# Altium schematic sheet Accelerometers.SchDoc: =DT_SCH_Title
size A4; Organization: Droid Technologies; SheetNumber: 9; SheetTotal: 22
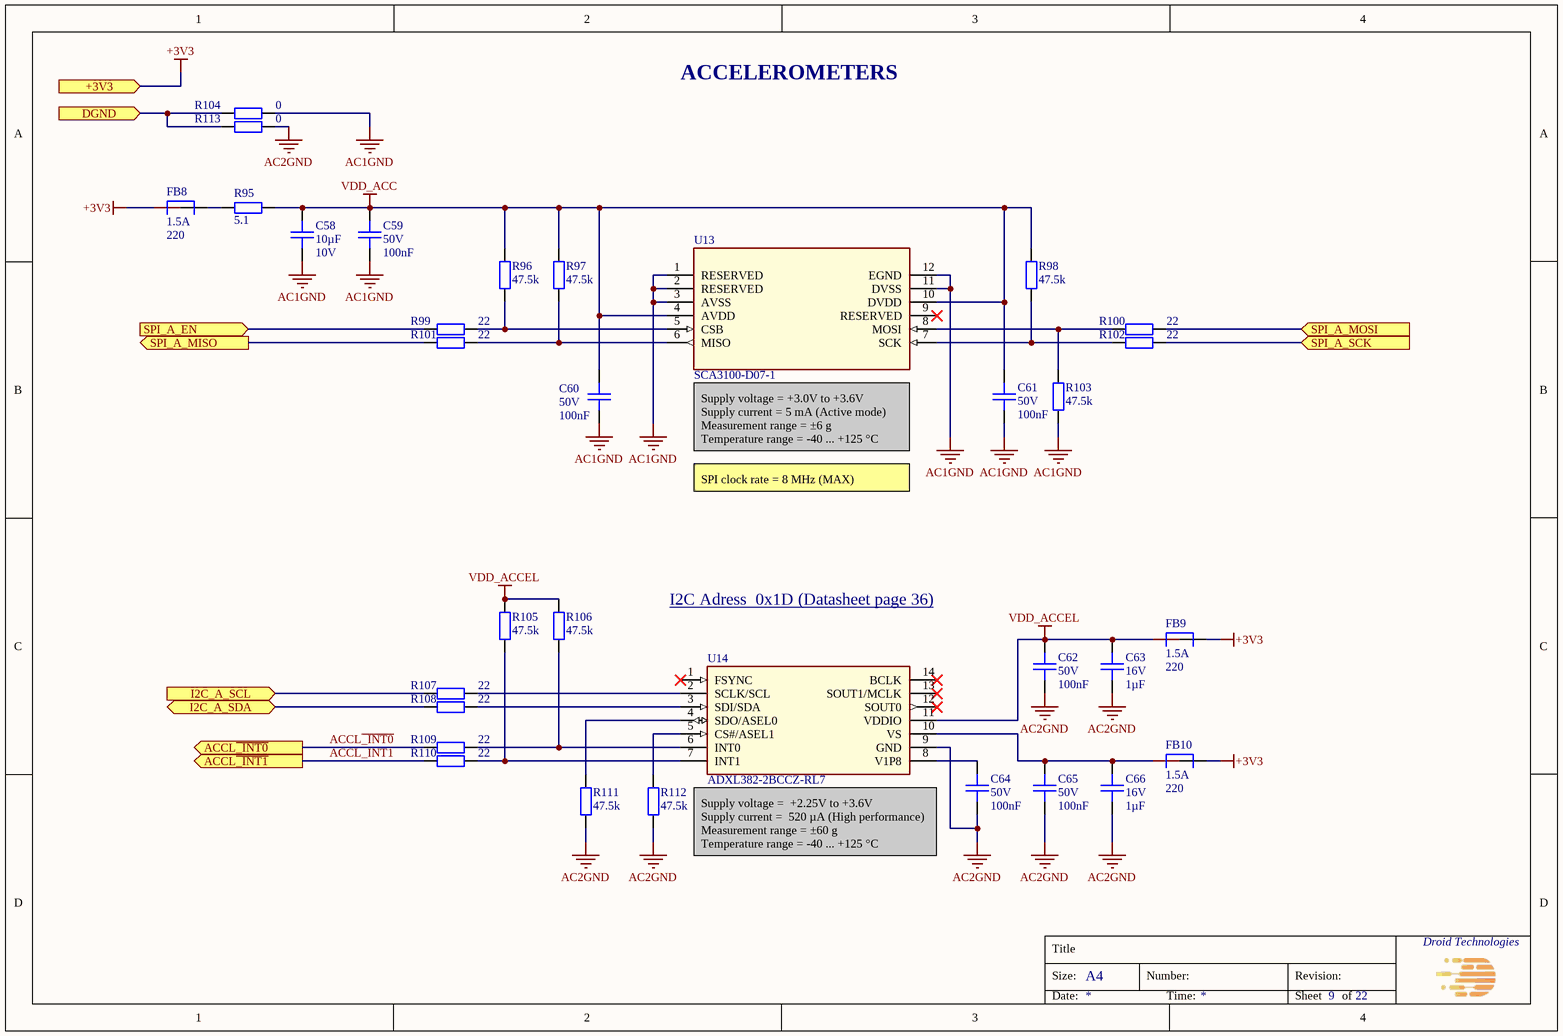
[diagram p0: Accelerometers.SchDoc]

## Parts
C58  Capacitance: 10µF  Voltage Rating: 10V  [CAPC200X125X145L50]  (hidden comment: CGA4J1X8L1A106K125AC)
C59  Voltage Rating: 50V  Capacitance: 100nF  [CAPC100x50x50L25]  (hidden comment: GCM155L8EH104KE07D)
C60  Voltage Rating: 50V  Capacitance: 100nF  [CAPC100x50x50L25]  (hidden comment: GCM155L8EH104KE07D)
C61  Voltage Rating: 50V  Capacitance: 100nF  [CAPC100x50x50L25]  (hidden comment: GCM155L8EH104KE07D)
C62  Voltage Rating: 50V  Capacitance: 100nF  [CAPC100x50x50L25]  (hidden comment: GCM155L8EH104KE07D)
C63  Voltage Rating: 16V  Capacitance: 1µF  [CAPC160X80X90L35]  (hidden comment: GCG188L8EE105KA07D)
C64  Voltage Rating: 50V  Capacitance: 100nF  [CAPC100x50x50L25]  (hidden comment: GCM155L8EH104KE07D)
C65  Voltage Rating: 50V  Capacitance: 100nF  [CAPC100x50x50L25]  (hidden comment: GCM155L8EH104KE07D)
C66  Voltage Rating: 16V  Capacitance: 1µF  [CAPC160X80X90L35]  (hidden comment: GCG188L8EE105KA07D)
FB8  Imax: 1.5A  Impedance: 220  [BEADC160X80X95L40]  (hidden comment: BLM18KG221BH1D)
FB9  Imax: 1.5A  Impedance: 220  [BEADC160X80X95L40]  (hidden comment: BLM18KG221BH1D)
FB10  Imax: 1.5A  Impedance: 220  [BEADC160X80X95L40]  (hidden comment: BLM18KG221BH1D)
R95  Resistance: 5.1  [RESC100X50X40L25]  (hidden comment: RC0402FR-075R1L)
R96  Resistance: 47.5k  [RESC100X50X40L25]  (hidden comment: RC0402FR-0747K5L)
R97  Resistance: 47.5k  [RESC100X50X40L25]  (hidden comment: RC0402FR-0747K5L)
R98  Resistance: 47.5k  [RESC100X50X40L25]  (hidden comment: RC0402FR-0747K5L)
R99  Resistance: 22  [RESC100X50X40L25]  (hidden comment: RC0402FR-0722RL)
R100  Resistance: 22  [RESC100X50X40L25]  (hidden comment: RC0402FR-0722RL)
R101  Resistance: 22  [RESC100X50X40L25]  (hidden comment: RC0402FR-0722RL)
R102  Resistance: 22  [RESC100X50X40L25]  (hidden comment: RC0402FR-0722RL)
R103  Resistance: 47.5k  [RESC100X50X40L25]  (hidden comment: RC0402FR-0747K5L)
R104  Resistance: 0  [RESC160X80X55L30]  (hidden comment: RC0603FR-070RL)
R105  Resistance: 47.5k  [RESC100X50X40L25]  (hidden comment: RC0402FR-0747K5L)
R106  Resistance: 47.5k  [RESC100X50X40L25]  (hidden comment: RC0402FR-0747K5L)
R107  Resistance: 22  [RESC100X50X40L25]  (hidden comment: RC0402FR-0722RL)
R108  Resistance: 22  [RESC100X50X40L25]  (hidden comment: RC0402FR-0722RL)
R109  Resistance: 22  [RESC100X50X40L25]  (hidden comment: RC0402FR-0722RL)
R110  Resistance: 22  [RESC100X50X40L25]  (hidden comment: RC0402FR-0722RL)
R111  Resistance: 47.5k  [RESC100X50X40L25]  (hidden comment: RC0402FR-0747K5L)
R112  Resistance: 47.5k  [RESC100X50X40L25]  (hidden comment: RC0402FR-0747K5L)
R113  Resistance: 0  [RESC160X80X55L30]  (hidden comment: RC0603FR-070RL)
U13  SCA3100-D07-1  [SCA3100-D07-1]
U14  ADXL382-2BCCZ-RL7  [14-LGA (2.9x2.8)]

## Ports
+3V3 (in), ACCL~{_INT0} (out), ACCL~{_INT1} (out), DGND (in), I2C_A_SCL (in), I2C_A_SDA (bidir), SPI_A_EN (in), SPI_A_MISO (out), SPI_A_MOSI (in), SPI_A_SCK (in)

## Nets
+3V3: FB8.1 FB9.2 FB10.2 ; port +3V3
AC1GND: C58.1 C59.1 C60.1 C61.1 R103.1 R104.1 U13.1(RESERVED) U13.2(RESERVED) U13.3(AVSS) U13.11(DVSS) U13.12(EGND)
AC2GND: C62.1 C63.1 C64.1 C65.1 C66.1 R111.1 R112.1 R113.1 U14.9(GND)
VDD_ACC: C58.2 C59.2 C60.2 C61.2 R95.2 R96.2 R97.2 R98.2 U13.4(AVDD) U13.10(DVDD)
VDD_ACCEL: C62.2 C63.2 FB9.1 R105.2 R106.2 U14.11(VDDIO)
ACCL~{_INT0}: R109.1 ; port ACCL~{_INT0}
ACCL~{_INT1}: R110.1 ; port ACCL~{_INT1}
DGND: R104.2 R113.2 ; port DGND
I2C_A_SCL: R107.1 ; port I2C_A_SCL
I2C_A_SDA: R108.1 ; port I2C_A_SDA
SPI_A_EN: R99.1 ; port SPI_A_EN
SPI_A_MISO: R101.1 ; port SPI_A_MISO
SPI_A_MOSI: R100.2 ; port SPI_A_MOSI
SPI_A_SCK: R102.2 ; port SPI_A_SCK
NetC64_2: C64.2 U14.8(V1P8)
NetC65_2: C65.2 C66.2 FB10.1 U14.10(VS)
NetFB8_2: FB8.2 R95.1
NetR96_1: R96.1 R99.2 U13.5(CSB)
NetR97_1: R97.1 R101.2 U13.6(MISO)
NetR98_1: R98.1 R102.1 U13.7(SCK)
NetR100_1: R100.1 R103.2 U13.8(MOSI)
NetR105_1: R105.1 R110.2 U14.7(INT1)
NetR106_1: R106.1 R109.2 U14.6(INT0)
NetR107_2: R107.2 U14.2(SCLK/SCL)
NetR108_2: R108.2 U14.3(SDI/SDA)
NetR111_2: R111.2 U14.4(SDO/ASEL0)
NetR112_2: R112.2 U14.5(CS#/ASEL1)

Not connected (* = marked no-connect by the designer): U13 9(RESERVED)*; U14 1(FSYNC)* 12(SOUT0)* 13(SOUT1/MCLK)* 14(BCLK)*

## Notes on the sheet
- ACCELEROMETERS
- (near U13) Supply voltage = +3.0V to +3.6V
  Supply current = 5 mA (Active mode)
  Measurement range = ±6 g
  Temperature range = -40 ... +125 °C
- SPI clock rate = 8 MHz (MAX)
- I2C Adress  0x1D (Datasheet page 36) <https://www.analog.com/media/en/technical-documentation/data-sheets/adxl382.pdf>
- Supply voltage =  +2.25V to +3.6V
  Supply current =  520 µA (High performance)
  Measurement range = ±60 g
  Temperature range = -40 ... +125 °C
- Title
- Size:
- A4
- Number:
- Revision:
- Date:
- Time:
- Sheet
- of

## Library data of the parts
C58 = CMP-001-1984-2: CAP CER 10UF 10V X8L 0805; Manufacturer: TDK Corporation; Tolerance: 10%; Op Temp min: -55°C; Op Temp max: 150°C; ComponentLink3Description: Digikey; Mounting Type: SM; Ratings: AEC-Q200; ComponentLink1Description: Datasheet; ComponentLink3URL: https://www.digikey.com/en/products/detail/tdk-corporation/CGA4J1X8L1A106K125AC/9991388; Lead Spacing: 0mm; MPN: CGA4J1X8L1A106K125AC; Size: 2.00mm x 1.25mm; Height max: 1.5mm; ComponentLink2URL: https://eu.mouser.com/ProductDetail/TDK/CGA4J1X8L1A106K125AC?qs=gZXFycFWdANzH%252B2UvJJjtQ%3D%3D; Package: 0805 (2012 Metric); ComponentLink2Description: Mouser; Dielectric: X8L; ComponentLink1URL: https://product.tdk.com/en/search/capacitor/ceramic/mlcc/info?part_no=CGA4J1X8L1A106K125AC
C59-C62 C64 C65 = CMP-001-1980-2: CAP CER 0.1UF 50V X8L 0402; Manufacturer: Murata Electronics; Op Temp max: 150°C; Op Temp min: -55°C; Tolerance: 10%; Height max: 550µm; ComponentLink3Description: Digikey; Mounting Type: SM; ComponentLink3URL: https://www.digikey.com/en/products/detail/murata-electronics/GCM155L8EH104KE07D/11618823; Package: 0402 (1005 Metric); Lead Spacing: 0mm; MPN: GCM155L8EH104KE07D; Size: 1.00mm x 0.50mm; Ratings: AEC-Q200; ComponentLink1URL: https://www.murata.com/en-us/products/productdetail?partno=GCM155L8EH104KE07%23; ComponentLink1Description: Datasheet; Dielectric: X8L; ComponentLink2Description: Mouser; ComponentLink2URL: https://eu.mouser.com/ProductDetail/Murata-Electronics/GCM155L8EH104KE07D?qs=1mbolxNpo8fQSHf0HYnZWw%3D%3D
C63 C66 = CMP-001-1982-2: CAP CER 1UF 16V X8L 0603; Manufacturer: Murata Electronics; Tolerance: 10%; Op Temp min: -55°C; Op Temp max: 150°C; ComponentLink3URL: https://www.digikey.com/en/products/detail/murata-electronics/GCG188L8EE105KA07D/10695125; Package: 0603 (1608 Metric); MPN: GCG188L8EE105KA07D; ComponentLink2URL: https://eu.mouser.com/ProductDetail/Murata-Electronics/GCG188L8EE105KA07D?qs=rrS6PyfT74dFMfTR80dVTA%3D%3D; Dielectric: X8L; Size: 1.60mm x 0.80mm; ComponentLink1Description: Datasheet; ComponentLink1URL: https://www.murata.com/en-us/products/productdetail?partno=GCG188L8EE105KA07%23; ComponentLink2Description: Mouser; Height max: 900µm; Mounting Type: SM; ComponentLink3Description: Digikey; Lead Spacing: 0mm; Ratings: AEC-Q200
FB8-FB10 = CMP-001-1981-1: FERRITE BEAD 220 OHM 0603 1LN; Manufacturer: Murata Electronics; DCR: 50m; Op Temp min: -55°C; Frequency: 100MHz; Op Temp max: 150°C; Number of Lines: 1; Mounting Type: SM; Size: 1.60mm x 0.80mm; ComponentLink2URL: https://eu.mouser.com/ProductDetail/Murata-Electronics/BLM18KG221BH1D?qs=sJ5gq5MLFXpgEHYBdWUtkQ%3D%3D; ComponentLink1Description: Datasheet; ComponentLink1URL: https://www.murata.com/en-us/products/productdata/8798137286686/QNFA9129.pdf; Lead Spacing: 0mm; Ratings: AEC-Q200; ComponentLink3Description: Digikey; ComponentLink3URL: https://www.digikey.com/en/products/detail/murata-electronics/BLM18KG221BH1D/6156000; Height max: 950µm; Package: 0603 (1608 Metric); ComponentLink2Description: Mouser; MPN: BLM18KG221BH1D
R95 = CMP-00125-8: RES 5.1 OHM 1% 1/16W 0402; Manufacturer: YAGEO; Power: 63mW; Temperature Coefficient: ±200ppm; Op Temp max: 155°C; Op Temp min: -55°C; ComponentLink3URL: https://www.digikey.com/en/products/detail/yageo/RC0402FR-075R1L/5917722; ComponentLink2Description: Mouser; ComponentLink2URL: https://eu.mouser.com/ProductDetail/YAGEO/RC0402FR-075R1L?qs=%2Fha2pyFaduhjtLcYvKXQ8B9EFTm6YmMloHxcmTFokS12j5yrT26S1A%3D%3D; Size: 1.00mm x 0.50mm; ComponentLink3Description: Digikey; Package: 0402 (1005 Metric); Ratings: -; Tolerance: 1%; MPN: RC0402FR-075R1L; ComponentLink1URL: https://www.yageo.com/upload/media/product/productsearch/datasheet/rchip/PYu-RC_Group_51_RoHS_L_12.pdf; Mounting Type: SM; Composition: Thick Film; Height max: 400µm; ComponentLink1Description: Datasheet
R96-R98 R103 R105 R106 R111 R112 = CMP-001-0277-7: RES 47.5K OHM 1% 1/16W 0402; Manufacturer: YAGEO; Op Temp min: -55°C; Power: 63mW; Temperature Coefficient: ±100ppm; Op Temp max: 155°C; ComponentLink1URL: https://www.yageo.com/upload/media/product/productsearch/datasheet/rchip/PYu-RC_Group_51_RoHS_L_12.pdf; ComponentLink1Description: Datasheet; MPN: RC0402FR-0747K5L; ComponentLink3Description: Digikey; ComponentLink2URL: https://eu.mouser.com/ProductDetail/YAGEO/RC0402FR-0747K5L?qs=V1yeUXFNrklfu86Rfgihxg%3D%3D; Mounting Type: SM; Tolerance: 1%; Package: 0402 (1005 Metric); Height max: 400µm; ComponentLink2Description: Mouser; ComponentLink3URL: https://www.digikey.com/en/products/detail/yageo/RC0402FR-0747K5L/726617; Size: 1.00mm x 0.50mm; Composition: Thick Film; Ratings: -
R99-R102 R107-R110 = CMP-001-0482-4: RES 22 OHM 1% 1/16W 0402; Manufacturer: YAGEO; Temperature Coefficient: ±100ppm; Op Temp max: 155°C; Op Temp min: -55°C; Power: 63mW; Ratings: -; ComponentLink3URL: https://www.digikey.com/en/products/detail/yageo/RC0402FR-0722RL/726562; ComponentLink2URL: https://eu.mouser.com/ProductDetail/YAGEO/RC0402FR-0722RL?qs=V1yeUXFNrkkRg6zf08ADKQ%3D%3D; MPN: RC0402FR-0722RL; ComponentLink1Description: Datasheet; ComponentLink3Description: Digikey; Tolerance: 1%; Size: 1.00mm x 0.50mm; ComponentLink1URL: https://www.yageo.com/upload/media/product/productsearch/datasheet/rchip/PYu-RC_Group_51_RoHS_L_12.pdf; Composition: Thick Film; ComponentLink2Description: Mouser; Mounting Type: SM; Package: 0402 (1005 Metric); Height max: 400µm
R104 R113 = CMP-001-0927-2: RES 0 OHM JUMPER 1/10W 0603; Manufacturer: YAGEO; Op Temp min: -55°C; Op Temp max: 155°C; Power: 100mW; Tolerance: 0%; Height max: 550µm; ComponentLink2URL: https://eu.mouser.com/ProductDetail/YAGEO/RC0603FR-070RL?qs=0yPvnVz5%2FmpDQv43TwvCfw%3D%3D; Temperature Coefficient: -; ComponentLink3Description: Digikey; ComponentLink2Description: Mouser; MPN: RC0603FR-070RL; ComponentLink1URL: https://www.yageo.com/upload/media/product/productsearch/datasheet/rchip/PYu-RC_Group_51_RoHS_L_12.pdf; Ratings: -; Size: 1.60mm x 0.80mm; Composition: Thick Film; Mounting Type: SM; ComponentLink3URL: https://www.digikey.com/en/products/detail/yageo/RC0603FR-070RL/1304008; Package: 0603 (1608 Metric); ComponentLink1Description: Datasheet
U13 = SCA3100-D07-1: ACCELEROMETER 6G SPI 12SMD; Manufacturer: Murata Electronics; MPN: SCA3100-D07-1
U14 = ADXL382-2BCCZ-RL7: Accelerometer X, Y, Z Axis ±15g, 30g, 60g 50Hz ~ 8kHz 14-LGA (2.9x2.8); Manufacturer: Analog Devices Inc.; MPN: ADXL382-2BCCZ-RL7